# Altium schematic sheet Notebook image fidelity.SchDoc
size A4
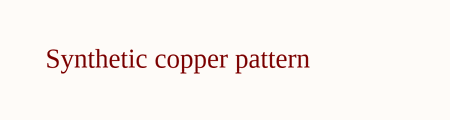
[diagram p0: Notebook image fidelity.SchDoc]

## Notes on the sheet
- Synthetic copper pattern